# Altium schematic sheet COMM.schdoc
size 297 x 209 mm; Symbol: Drawing-Symbol_A4; Company: 上海道尔汇控智能科技有限公司; Version: V1.2; Page Size: A4; @Project Name: YTM32; @Page Count: 5; @Update Date: 2025-12-22; @Create Date: 2025-10-25; @Schematic Name: YTM32_MotorControl; @Page No: 3; @Page Name: COMM; @Create Time: 03:17:57; @Update Time: 01:04:27; Border: 1; Width: 1170; Height: 825; Region Start: 1; X Region Count: 6; Y Region Count: 4; Blade Width: 10; Title Block Position: 3; @Board Name: YTM32_MotorControl; Device: Drawing-Symbol_A4
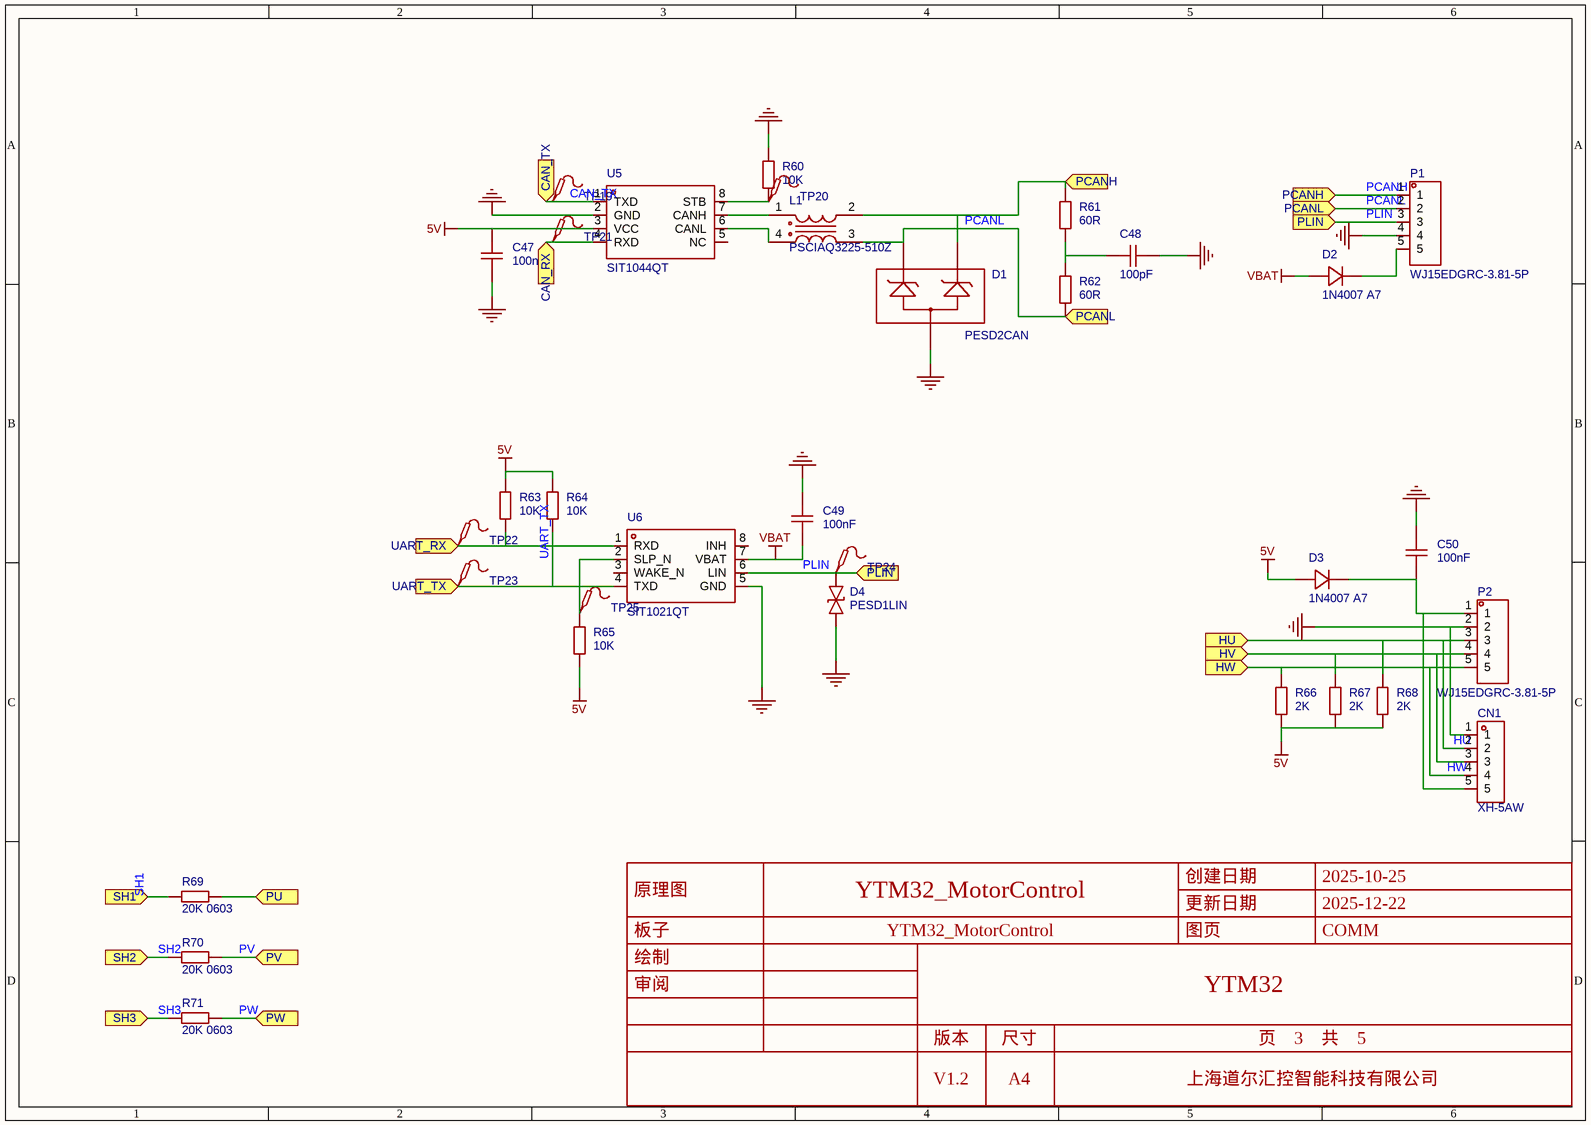
[diagram p0: COMM.schdoc]

## Parts
C47  100nF  [C0603]
C48  100pF  [C0603]
C49  100nF  [C0603]
C50  100nF  [C0603]
CN1  XH-5AW  [CONN-TH_5P-P2.54_XH-5AW_C2908614]
D1  PESD2CAN  [SOT-23-3_L2.9-W1.3-P1.90-LS2.4-BR]
D2  1N4007 A7  [SOD-123FL_L2.8-W1.8-LS3.7-RD]
D3  1N4007 A7  [SOD-123FL_L2.8-W1.8-LS3.7-RD]
D4  PESD1LIN  [SOD-323_L1.7-W1.3-LS2.5-BI]
L1  PSCIAQ3225-510Z  [FILTER-SMD_4P-L3.2-W2.5-BL_SDCW3225L-2-601TF]
P1  WJ15EDGRC-3.81-5P  [CONN-TH_5P-P3.81_WJ15EDGRC-3.81-5P]
P2  WJ15EDGRC-3.81-5P  [CONN-TH_5P-P3.81_WJ15EDGRC-3.81-5P]
R60  10K  [R0603]
R61  60R  [R0603]
R62  60R  [R0603]
R63  10K  [R0603]
R64  10K  [R0603]
R65  10K  [R0603]
R66  2K  [R0603]
R67  2K  [R0603]
R68  2K  [R0603]
R69  20K 0603  [R0603]
R70  20K 0603  [R0603]
R71  20K 0603  [R0603]
TP19  (no value)  [Test-Point-0.5mm]
TP20  (no value)  [Test-Point-0.5mm]
TP21  (no value)  [Test-Point-0.5mm]
TP22  (no value)  [Test-Point-0.5mm]
TP23  (no value)  [Test-Point-0.5mm]
TP24  (no value)  [Test-Point-0.5mm]
TP25  (no value)  [Test-Point-0.5mm]
U5  SIT1044QT  [SOIC-8_L4.9-W3.9-P1.27-LS6.0-BL]
U6  SIT1021QT  [SOIC-8_L4.9-W3.9-P1.27-LS6.0-BL]

## Ports
CAN_RX (in), CAN_TX (in), HU (in), HV (in), HW (in), PCANH (in), PCANL (in), PLIN (in), PU (in), PV (in), PW (in), SH1 (in), SH2 (in), SH3 (in), UART_RX (in), UART_TX (in)

## Nets
5V: C47.2 D3.2(A) R63.1 R64.1 R65.2 R66.2 R67.2 R68.2 U5.3(VCC)
GND: C47.1 C48.1 C49.2 C50.2 CN1.1 D1.3 D4.1 P1.4 P2.2 R60.1 U5.2(GND) U6.5(GND)
VBAT: C49.1 D2.2(A) U6.7(VBAT)
CAN_RX: TP21.1 U5.4(RXD) ; port CAN_RX
CAN_TX: TP19.1 U5.1(TXD) ; port CAN_TX
HU: CN1.2 P2.3 R68.1 ; port HU
HV: CN1.3 P2.4 R67.1 ; port HV
HW: CN1.4 P2.5 R66.1 ; port HW
PCANH: D1.1 L1.2 P1.1 R61.1 ; port PCANH
PCANL: D1.2 L1.3 P1.2 R62.2 ; port PCANL
PLIN: D4.2 P1.3 TP24.1 U6.6(LIN) ; port PLIN
PU: R69.1 ; port PU
PV: R70.1 ; port PV
PW: R71.1 ; port PW
SH1: R69.2 ; port SH1
SH2: R70.2 ; port SH2
SH3: R71.2 ; port SH3
UART_RX: R63.2 TP22.1 U6.1(RXD) ; port UART_RX
UART_TX: R64.2 TP23.1 U6.4(TXD) ; port UART_TX
NetC48_2: C48.2 R61.2 R62.1
NetC50_1: C50.1 CN1.5 D3.1(K) P2.1
NetD2_1: D2.1(K) P1.5
NetL1_1: L1.1 U5.7(CANH)
NetL1_4: L1.4 U5.6(CANL)
NetR60_2: R60.2 TP20.1 U5.8(STB)
NetR65_1: R65.1 TP25.1 U6.2(SLP_N)

Not connected (* = marked no-connect by the designer): U5 5(NC); U6 3(WAKE_N) 8(INH)

## Notes on the sheet
- 创建日期
- 2025-10-25
- 原理图
- 板子
- YTM32_MotorControl
- 更新日期
- 图页
- 2025-12-22
- COMM
- 绘制
- 审阅
- YTM32
- 版本
- V1.2
- 尺寸
- A4
- 页    3    共    5
- 上海道尔汇控智能科技有限公司

## Library data of the parts
C47-C50 = CAP_0603: ConvertToPcb: yes; SymbolName: CapAcitance; ModelId: ac125912035d415993ca9572d50418b1; ModelName: C0603_L1.6-W0.8-H0.8; ModelTransform: 62.992,31.496,0,0,0,0,0,0,0; Device: CAP_0603; AddInBom: yes; Supplier Footprint: 0603; FootprintName: C0603
  C47 C49 C50: Value: 100nF
  C48: Value: 100pF
CN1 = XH-5AW: 插针结构:1x5P;间距:2.54mm;安装方式:弯插;参考系列:XH;总PIN数:5P;排数:1;每排PIN数:5;行距:-;额定电流:3A;触头材质:黄铜;触头镀层:锡;工作温度:-25℃~+85℃;; Manufacturer: HCTL(华灿天禄); Symbol: XH-5AW_C2908614; AddInBom: yes; ModelId: a1cd2669ab33486283ac2299a64a7ffe; ModelTransform: 590.55,303.936,0,0,0,0,0,139.764,-118.11; Pins Structure: 1x5P; Pitch: 2.54mm; Reference Series: XH; Number of PINs Per Row: 5; Current Rating: 3A; Voltage Rating: 250V; Plastic Material: PA66; Flame Retardant Rating: UL94V-0; Z-Height of the Board: 5.9mm; Y-Width of Bottom Edge on Board: 7mm; Device: XH-5AW; LCSC Part Name: 1x5P 间距:2.54mm 弯插 系列:XH; SupplierPart: C2908614; ManufacturerPart: XH-5AW; Supplier Footprint: 弯插,P=2.5mm; JLCPCB Part Class: 扩展库; Datasheet: https://item.szlcsc.com/datasheet/XH-5AW/3184385.html; Supplier: LCSC; ConvertToPcb: yes; FootprintName: CONN-TH_5P-P2.54_XH-5AW_C2908614; ModelName: CONN-TH_5P-P2.54_XH-5AW_C2908614; Mounting Type: 弯插; Number of Pins: 5P; Number of Rows: 1; Row Spacing: -; Contact Material: 黄铜; Contact Plating: 锡; Operating Temperature: -25℃~+85℃
D1 = PESD2CAN_C2687131: Manufacturer: UMW(友台半导体); AddInBom: yes; ModelId: c62791f0466c4ae2a892c056b845b0ca; ModelName: SOT-23-3P_L2.9-W1.3-H1.0-LS2.4-P0.95; ModelTransform: 98.425,114.173,0,180,0,0,0.0005,-0.0005,0; Type: ESD; Symbol: PESD2CAN_C2687131; Device: PESD2CAN_C2687131; LCSC Part Name: PESD2CAN; SupplierPart: C2687131; ManufacturerPart: PESD2CAN; Supplier Footprint: SOT-23; JLCPCB Part Class: 扩展库; Datasheet: https://atta.szlcsc.com/upload/public/pdf/source/20231109/8F2428877D1F247F6D75E5CDAF1434F5.pdf; Supplier: LCSC; ConvertToPcb: yes; FootprintName: SOT-23-3_L2.9-W1.3-P1.90-LS2.4-BR
D2 D3 = 1N4007 A7: 二极管配置:-;正向压降(Vf):1V@1A;直流反向耐压(Vr):1kV;整流电流:1A;; Manufacturer: MSKSEMI(美森科); AddInBom: yes; ModelId: b8c4b3388b3d4c198b22b876116f592b; ModelTransform: 145.669,70.866,0,0,0,0,0,0,0; Voltage - Forward(Vf@If): 1V@1A; Voltage - DC Reverse(Vr): 1kV; Current - Rectified: 1A; Reverse Leakage Current (Ir): 10uA@1kV; Operating Junction Temperature Range: -55℃~+150℃; Symbol: 1N4007 A7; Device: 1N4007 A7; LCSC Part Name: 1N4007 A7; SupplierPart: C2902912; ManufacturerPart: 1N4007 A7; Supplier Footprint: SOD-123FL; JLCPCB Part Class: 扩展库; Datasheet: https://item.szlcsc.com/datasheet/1N4007%2520A7/3157366.html; Supplier: LCSC; ConvertToPcb: yes; FootprintName: SOD-123FL_L2.8-W1.8-LS3.7-RD; ModelName: SOD-123FL_L2.8-W1.8-LS3.7-RD; Diode Configuration: -
D4 = PESD1LIN_C2831530: Manufacturer: UMW(友台半导体); AddInBom: yes; ModelId: 3c4d3117213c44d8be2b8463c3660d20; ModelTransform: 98.425,51.181,0,0,0,0,-0.001,0.006,0; Symbol: PESD1LIN_C2831530; Device: PESD1LIN_C2831530; Supplier: LCSC; Supplier Part: C2831530; Manufacturer Part: PESD1LIN; JLCPCB Part Class: 扩展库; LCSC Part Name: PESD1LIN; Supplier Footprint: SOD-323; Datasheet: https://atta.szlcsc.com/upload/public/pdf/source/20240109/CA855839557A9261DE0C9B778532E4D3.pdf; ConvertToPcb: yes; FootprintName: SOD-323_L1.7-W1.3-LS2.5-BI; ModelName: SOD-323_L1.7-W1.3-LS2.5-BI
L1 = PSCIAQ3225-510Z: 线路数:2;电感 @ 频率:51uH@100kHz;阻抗 @ 频率:2.6kΩ@10MHz;直流电阻(DCR):700mΩ;; Manufacturer: PROD(谱罗德); AddInBom: yes; ModelId: 5cce1a6fa12f456f8938c97907b8fb57; ModelTransform: 126.7714,99.2124,0,0,0,0,0,0,0; Number of Lines: 2; Withstanding Voltage: 80V; Current Rating: 200mA; Voltage Rating: 80VAC; DC Resistance (DCR): 700mΩ; Symbol: PSCIAQ3225-510Z; Device: PSCIAQ3225-510Z; LCSC Part Name: 两路 1210共模滤波器 阻抗2.6kΩ@10MHz; SupplierPart: C3011567; ManufacturerPart: PSCIAQ3225-510Z; Supplier Footprint: 1210; JLCPCB Part Class: 扩展库; Datasheet: https://atta.szlcsc.com/upload/public/pdf/source/20221209/0F115E7BC87283E32C2A7BCB65AC9CDC.pdf; Supplier: LCSC; ConvertToPcb: yes; FootprintName: FILTER-SMD_4P-L3.2-W2.5-BL_SDCW3225L-2-601TF; ModelName: FILTER-SMD_4P-L3.2-W2.5-BL_SDCW3225L-2-601TF; Inductance @ Frequency: 51uH@100kHz; Voltage Rating - DC: 80V; Impedance @ Frequency: 2.6kΩ@10MHz; Operating Temperature: -25℃~+105℃
P1 P2 = WJ15EDGRC-3.81-5P: 连接器类型:板端/插座-闭口;固定方式:-;结构:1x5P;间距:3.81mm;颜色:-;安装方式:弯针;排数:1;每排PIN数:5;额定电流:-;额定电压:-;线规 - AWG:-;线规 - 平方毫米:-;工作温度:-40℃~+105℃;; Manufacturer: KANGNEX(康奈克斯电气); AddInBom: yes; ModelId: 1f5bfc586d7a497a94e16b2138b9ad12; ModelName: CONN-TH_WJ3.81-WI-5P; ModelTransform: 784.64406,360.2355,0,0,0,0,-0.197,-118.11,-137.795; Number of Positions or Pins: 1x5P; Pitch: 3.81mm; Number of PINs Per Row: 5; Symbol: WJ15EDGRC-3.81-5P; Device: WJ15EDGRC-3.81-5P; LCSC Part Name: 1x5P 3.81mm 排数:1 每排P数:5; SupplierPart: C8395; ManufacturerPart: WJ15EDGRC-3.81-5P; Supplier Footprint: 弯插,P=3.81mm; JLCPCB Part Class: 扩展库; Datasheet: https://item.szlcsc.com/datasheet/WJ15EDGRC-3.81-5P/8889.html; Supplier: LCSC; ConvertToPcb: yes; FootprintName: CONN-TH_5P-P3.81_WJ15EDGRC-3.81-5P; Connector Type: 板端/插座-闭口; Termination Style: -; Color: -; Mounting Type: 弯针; Number of Pins: 5P; Number of Rows: 1; Current Rating: -; Voltage Rating (Max): -; Wire Gauge - AWG: -; Wire Gauge - mm2: -; Operating Temperature: -40℃~+105℃; Connection Type: -; Outlet Direction (Vertical Basis): -
R60-R71 = Res_0603: Symbol: 电阻; ConvertToPcb: yes; ModelId: fc143cca1e79419f9cd78b61e9279f08; ModelTransform: 31.8897,63.7794,0,90,0,0,0,0,0; Device: Res_0603; AddInBom: yes; Supplier Footprint: 0603; FootprintName: R0603; ModelName: R0603
  R60 R63-R65: Value: 10K
  R61 R62: Value: 60R
  R66-R68: Value: 2K
  R69-R71: Value: 20K 0603
TP19-TP25 = Test-Point: Test Point 测试点; AddInBom: yes; Device: Test-Point; ConvertToPcb: yes; SymbolName: Test-Point; FootprintName: Test-Point-0.5mm
U5 = TJA1044GTJ: 类型:收发器;数据速率:5Mbps;; Manufacturer: NXP(恩智浦); AddInBom: yes; ModelId: e81d2f7d937b4a6ab1dca543ff5d56a4; ModelName: SOIC-8_L4.9-W3.9-H1.7-LS6.0-P1.27; ModelTransform: 189.751,236.22,0,0,0,0,0.0005,0.0005,0; Data Rate: 5Mbps; Supply Voltage: 4.75V~5.25V; Manufacturer Part: SIT1044QT; Device: TJA1044GTJ; Symbol: TJA1044GTJ; LCSC Part Name: 5Mbps 4.75V~5.25V; SupplierPart: C112937; Supplier Footprint: SOIC-8; JLCPCB Part Class: 扩展库; Datasheet: https://atta.szlcsc.com/upload/public/pdf/source/20170602/1496384425290.pdf; Supplier: LCSC; ConvertToPcb: yes; FootprintName: SOIC-8_L4.9-W3.9-P1.27-LS6.0-BL; Type: 收发器; Operating Temperature: -40℃~+150℃
U6 = TJA1021T/20/CM,118: 类型:收发器;通讯模式:全双工;驱动器数:1;接收器数:1;; Manufacturer: NXP(恩智浦); AddInBom: yes; ModelId: e81d2f7d937b4a6ab1dca543ff5d56a4; ModelName: SOIC-8_L4.9-W3.9-H1.7-LS6.0-P1.27; ModelTransform: 189.751,236.22,0,0,0,0,0.0005,0.0005,0; Duplex: 全双工; Number of Drivers: 1; Voltage - Supply: 5.5V~27V; Receiver Hysteresis: 175mV; Manufacturer Part: SIT1021QT; Symbol: TJA1021T/20/CM,118; Device: TJA1021T/20/CM,118; LCSC Part Name: LIN 2.2A/SAE J2602收发器; SupplierPart: C128810; Supplier Footprint: SOIC-8; JLCPCB Part Class: 扩展库; Datasheet: https://www.nxp.com/docs/en/data-sheet/TJA1021.pdf; Supplier: LCSC; ConvertToPcb: yes; FootprintName: SOIC-8_L4.9-W3.9-P1.27-LS6.0-BL; Type: 收发器; Number of Receivers: 1